# Altium schematic sheet Power.SchDoc
size A4; SheetNumber: 3; SheetTotal: 5
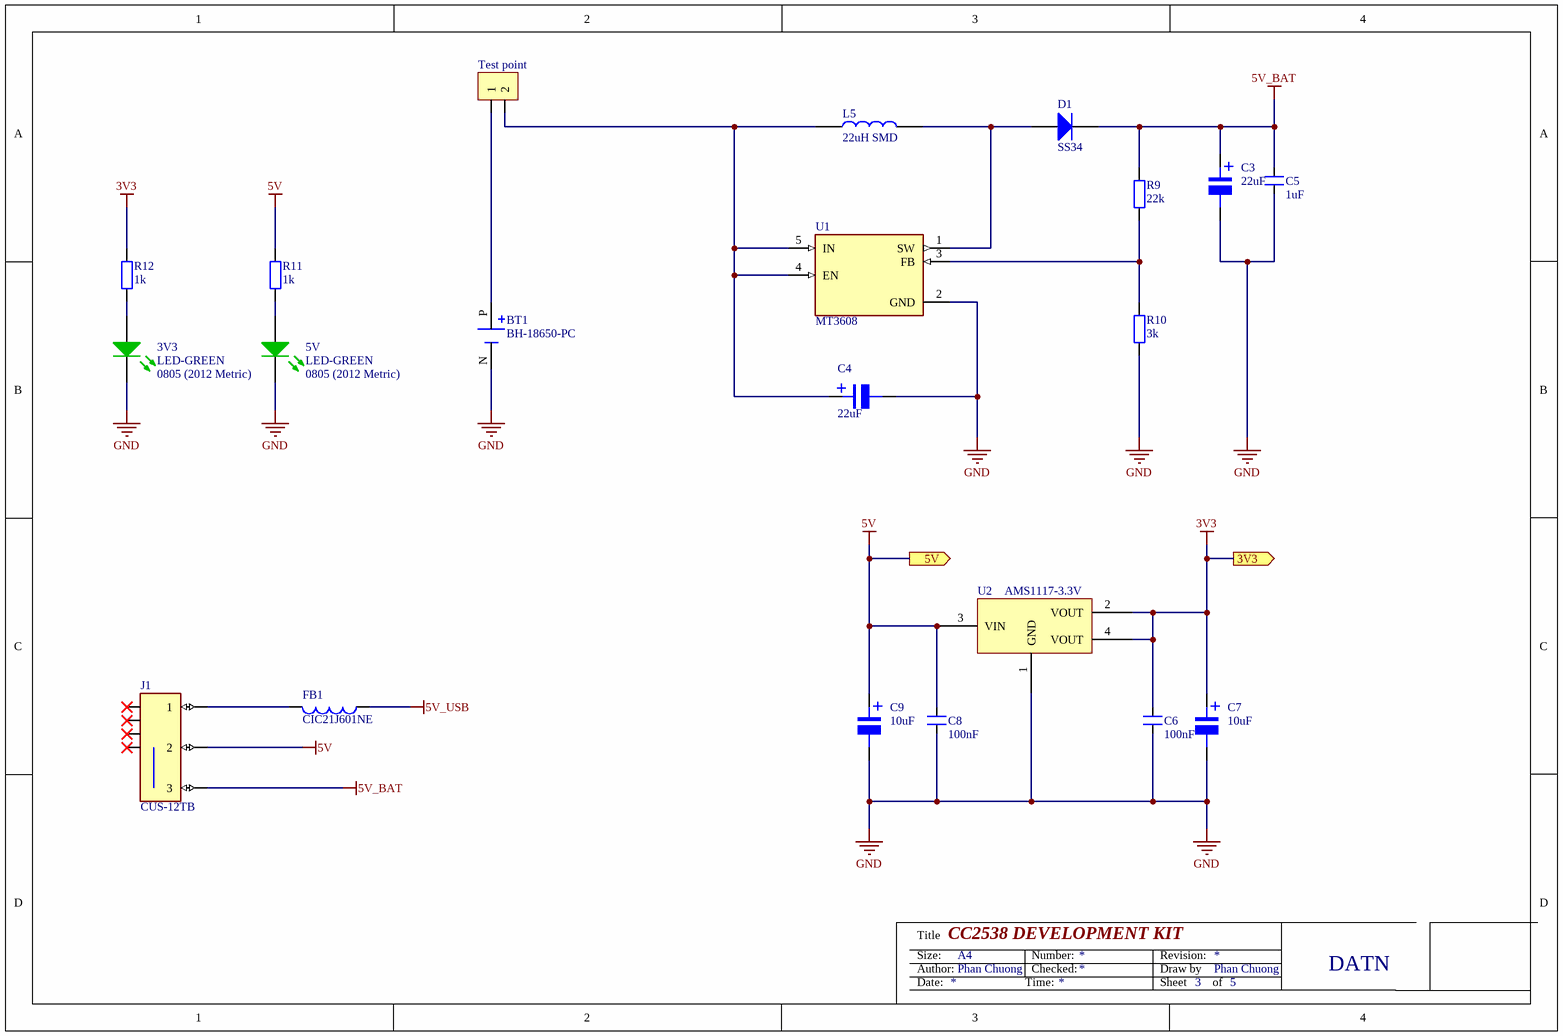
[diagram p0: Power.SchDoc]

## Parts
3V3  LED-GREEN  Package / Case: 0805 (2012 Metric)  [LED_SMD0805_GREEN]
5V  LED-GREEN  Package / Case: 0805 (2012 Metric)  [LED_SMD0805_GREEN]
BT1  BH-18650-PC  [BAT_BH-18650-PC]
C3  22uF  [tu nhom 6.3 (D)]
C4  22uF  [tu nhom 6.3 (D)]
C5  1uF  [SM-0805]
C6  100nF  [SM-0805]
C7  10uF  [tu nhom 6.3 (D)]
C8  100nF  [SM-0805]
C9  10uF  [tu nhom 6.3 (D)]
D1  SS34  [DIODE SMA]
FB1  CIC21J601NE  [INDC0805]
J1  CUS-12TB  [CUS-12B]
JP?  Test point  [JP 1x2 DT]
L5  22uH SMD  [Cuon Cam 7x7x5]
R9  22k  [RES-SMD-0805]
R10  3k  [RES-SMD-0805]
R11  1k  [RES-SMD-0805]
R12  1k  [RES-SMD-0805]
U1  MT3608  [SOT95P280X145-6N]
U2  AMS1117-3.3V  [SOT223]

## Ports
3V3 (out), 5V (out)

## Nets
3V3: C6.2 C7.1 R12.2 U2.2(VOUT) U2.4(VOUT) ; port 3V3
5V: C8.2 C9.1 J1.P$2(2) R11.1 U2.3(VIN) ; port 5V
5V_BAT: C3.1 C5.2 D1.2(K) J1.P$3(3) R9.2
5V_USB: FB1.1
GND: 3V3.2(K) 5V.2(K) BT1.N(NEG) C3.2 C4.2 C5.1 C6.1 C7.2 C8.1 C9.2 R10.1 U1.2(GND) U2.1(GND)
Net3V3_1: 3V3.1(A) R12.1
Net5V_1: 5V.1(A) R11.2
NetBT1_P: BT1.P(POS) JP?.1
NetC4_1: C4.1 JP?.2 L5.1 U1.4(EN) U1.5(IN)
NetD1_1: D1.1(A) L5.2 U1.1(SW)
NetFB1_2: FB1.2 J1.P$1(1)
NetR9_1: R9.1 R10.2 U1.3(FB)

Not connected (* = marked no-connect by the designer): J1 P$4(GND@1)* P$5(GND@2)* P$6(GND@3)* P$7(GND@4)*

## Notes on the sheet
- Title
- Size:
- Date:
- Author:
- CC2538 DEVELOPMENT KIT
- A4
- Phan Chuong
- Time:
- Number:
- Checked:
- Revision:
- Sheet
- Draw by
- of
- DATN
- (in symbol Tu Nhom 22uF 25V) +

## Library data of the parts
3V3 5V = LED_LTST-C171KGKT: LED GREEN CLEAR 0805 SMD; Manufacturer: Lite-On Inc.; Lens Color: Colorless; Millicandela Rating: 35mcd; Lens Style/Size: Rectangle with Flat Top, 1.40mm x 1.25mm; Voltage - Forward (Vf) (Typ): 2V; Current - Test: 20mA; Viewing Angle: 130°; Wavelength - Dominant: 571nm; Wavelength - Peak: 574nm; Supplier 1: Digi-Key; Manufacturer Part Number: LTST-C171KGKT; RoHS: RoHS Compliant; Category: Optoelectronics; Stock 1: 329702; Pricing 1: 1=0.35, 10=0.255, 25=0.188, 100=0.1344, 250=0.09136, 500=0.08062, 1000=0.06314 (USD); Packaging: Cut Tape (CT); Part Status: Active; Color: Green; Lens Transparency: Clear; Mounting Type: Surface Mount; Features: -; Size / Dimension: 2.00mm L x 1.25mm W; Height (Max): 0.90mm; ComponentLink1URL: http://optoelectronics.liteon.com/upload/download/DS22-2000-118/LTST-C171KGKT.pdf; ComponentLink1Description: http://optoelectronics.liteon.com/upload/download/DS22-2000-118/LTST-C171KGKT.pdf; Supplier Part Number 1: 160-1426-1-ND
BT1 = BH-18650-PC: Battery Holder (Open) 18650 1 Cell PC Pin; MF: Memory Protection Devices; SnapEDA_Link: https://www.snapeda.com/parts/BH-18650-PC/Memory+Protection+Devices/view-part/?ref=snap; Package: None; Value: *; MP: BH-18650-PC; Check_prices: https://www.snapeda.com/parts/BH-18650-PC/Memory+Protection+Devices/view-part/?ref=eda
C3 C4 C7 C9 = Tu Nhom 22uF 25V: Dán; Don_Vi: Con; So_Chan: 2; Ten_Linh_Kien: Tụ Nhôm 22uF 25V; Ma_Hang: MH007613; Chung_Loai: Dán; Kieu_Chan: *
C5 C6 C8 = CM: Cap SMD; Value: 103
D1 = Diode SS34 ( 1N5822 ): Dán; Don_Vi: Con; Ma_Hang: MH002104; Ten_Linh_Kien: Diode SS34 3A 40V SMA ( 1N5822 SS34A); Kieu_Chan: *; Chung_Loai: Dán
FB1 = FERRITE BEAD_CIC21J601NE: FERRITE BEAD 600 OHM 0805 1LN; Manufacturer: Samsung Electro-Mechanics; Filter Type: Power Line; Current Rating (Max): 1A; DC Resistance (DCR) (Max): 100 mOhm; Supplier 1: Digi-Key; Manufacturer Part Number: CIC21J601NE; RoHS: RoHS Compliant; Category: Filters; Stock 1: 98190; Pricing 1: 1=0.1, 10=0.066, 25=0.06, 50=0.054, 100=0.0396, 250=0.0288, 500=0.0264, 1000=0.0228 (USD); Packaging: Cut Tape (CT); Part Status: Active; Ratings: -; Operating Temperature: -55°C ~ 125°C; Package / Case: 0805 (2012 Metric); Mounting Type: Surface Mount; Height (Max): 0.043" (1.10mm); Size / Dimension: 0.079" L x 0.049" W (2.00mm x 1.25mm); ComponentLink1URL: http://www.samsungsem.com/kr/support/product-search/bead/CIC21J601NE.jsp; ComponentLink1Description: http://www.samsungsem.com/kr/support/product-search/bead/CIC21J601NE.jsp; Supplier Part Number 1: 1276-6371-1-ND
J1 = CUS-12TB: Slide Switch SPDT Surface Mount, Right Angle; MF: Nidec Copal; SnapEDA_Link: https://www.snapeda.com/parts/CUS-12TB/Nidec/view-part/?ref=snap; Package: None; Value: *; MP: CUS-12TB; Check_prices: https://www.snapeda.com/parts/CUS-12TB/Nidec/view-part/?ref=eda
JP? = JP 1x2 2.54 Duc Thang: Cắm; Ten_Linh_Kien: Jump Đơn Đực 2.54MM 1x40P Thẳng 11MM; Don_Vi: Con; Ma_Hang: MH000903; Ghi_Chu: *; Kieu_Chan: *; Chung_Loai: Cắm
L5 = CUON CAM 47uH SMD: Dán; Don_Vi: Con; Ma_Hang: MH004211; Ten_Linh_Kien: Cuộn Cảm 47uH 7x7x4MM CD74R; Ghi_Chu: *; Kieu_Chan: *; Chung_Loai: Dán
R9-R12 = R: Resistor R1/4W
U1 = MT3608: High Efficiency 1.2MHz2A Step Up Converter; MF: Aerosemi Technology Co., Ltd; Price: None; Availability: Not in stock; Package: Package; MP: MT3608; Value: *; SnapEDA_Link: https://www.snapeda.com/parts/MT3608/Aerosemi+Technology+Co.%252C+Ltd/view-part/?ref=snap; Check_prices: https://www.snapeda.com/parts/MT3608/Aerosemi+Technology+Co.%252C+Ltd/view-part/?ref=eda
U2 = AMS1117 SMD: Dán; Value: AMS1117-3.3V SOT223; Don_Vi: Con; Ma_Hang: MH000596; Ghi_Chu: *; Kieu_Chan: *; Chung_Loai: Dán